# EasyEDA Pro project ProPrj_DRV8701 - 副本_2026-07-18.epro, board PCB5_1
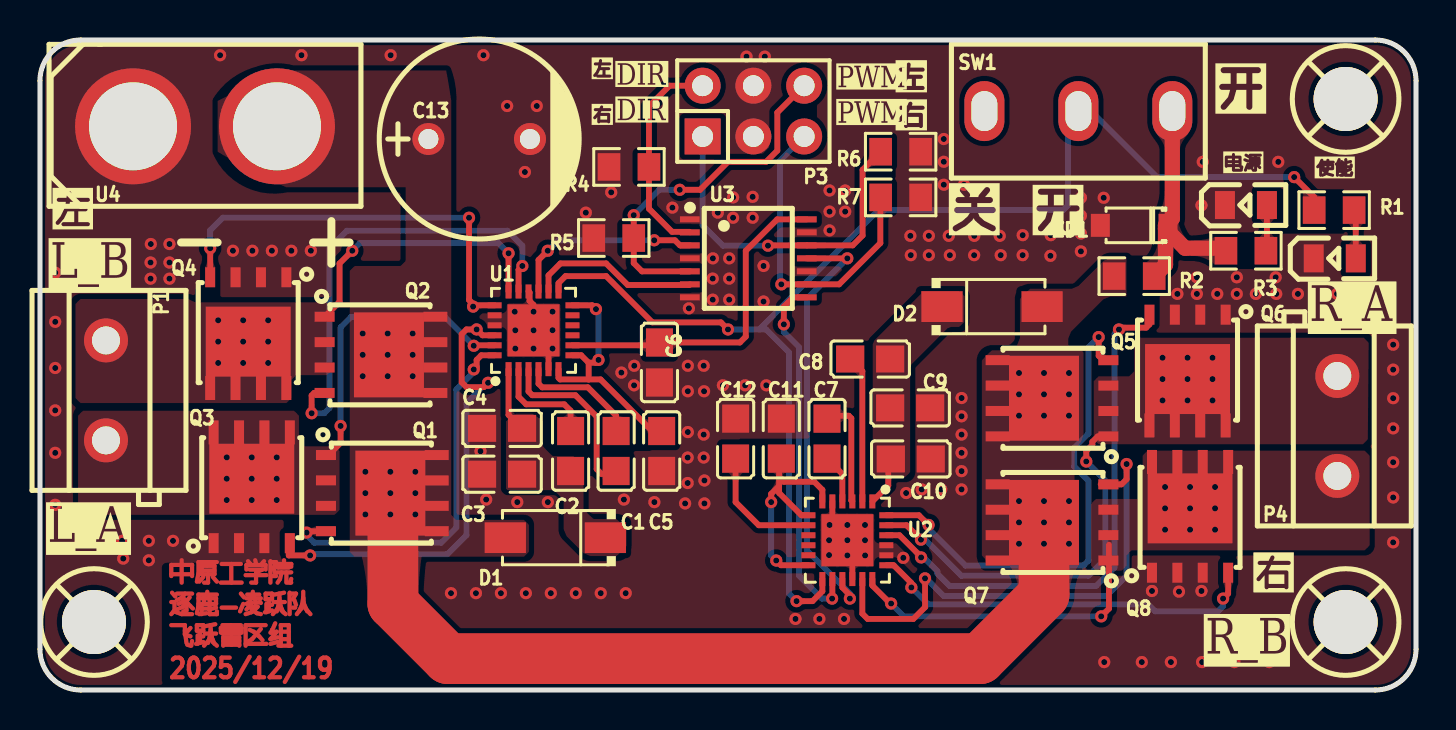
[diagram p8: board, top side]
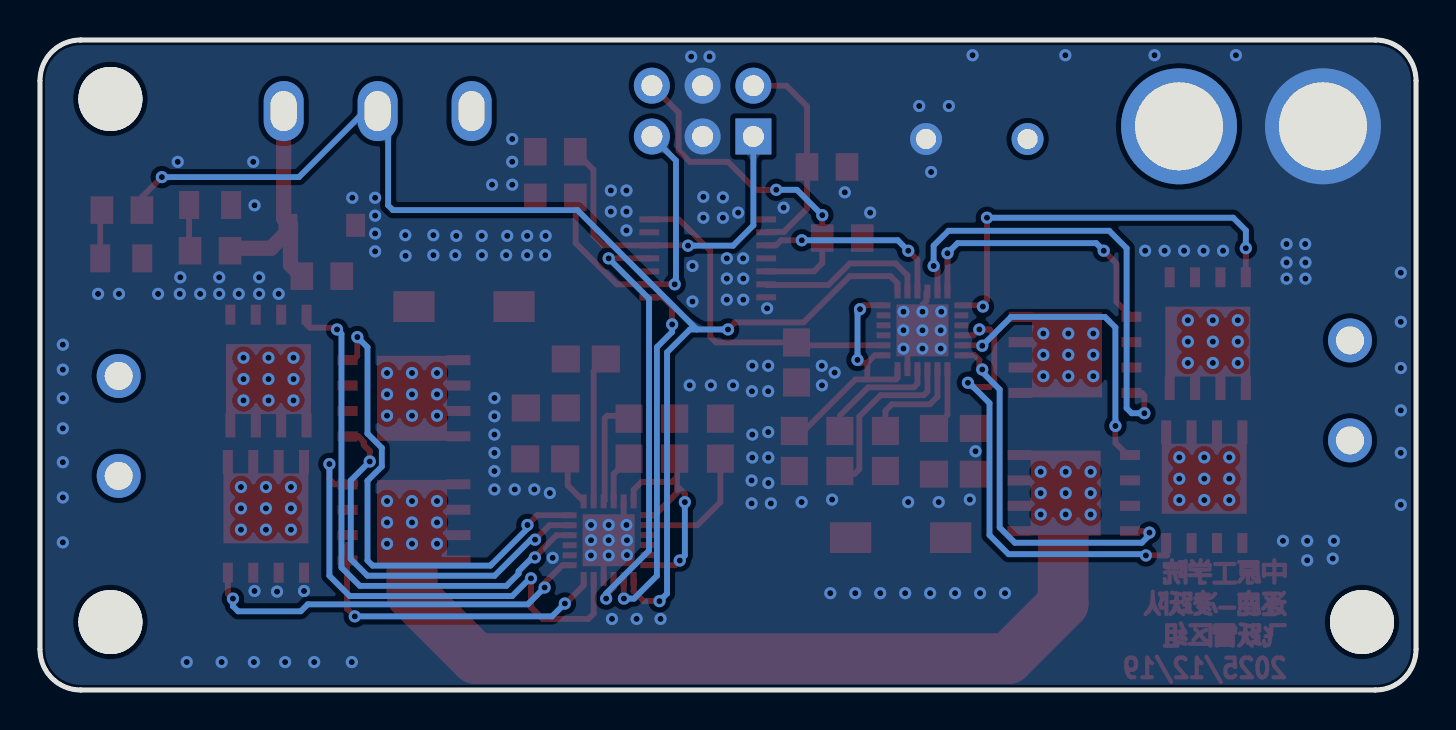
[diagram p9: board, bottom side, seen from below]

Outline 68.83 x 32.51 mm; copper layers: Top Layer, Bottom Layer. Coordinates in mm from the lower left corner of the outline.
Outline path: 0,30.48 0,2.03 arc(0.6,0.6) 2.03,0 66.8,0 arc(68.24,0.6) 68.83,2.03 68.83,30.48 arc(68.24,31.92) 66.8,32.51 2.03,32.51 arc(0.6,31.92) 0,30.48
Stack: Top Layer 0.035mm / Dielectric1 1.51mm FR4 er 4.5 / Bottom Layer 0.035mm

## Design rules (mm)
template: 自定义配置
spacing copperThickness1oz (default): track to track 0.102, other pairs 0.152 to 0.3
spacing copperThickness2oz: track to track 0.203, other pairs 0.152 to 0.3
track width copperThickness1oz (default): min 0.127, default 0.254, max 2.54
track width copperThickness2oz: min 0.203, default 0.254, max 2.54
differential pair differentialPair (default): width min 0.127, default 0.254, max 2.54; gap min 0.152, default 0.152
via viaSize (default): diameter min 0.5, default 0.61, max 10; hole min 0.3, default 0.305, max 6.3

## Placement (name value [footprint] x y rotation side)
C1  100nF  [C0805]  28.82 11.95 270 top
C2  1uF  [C0805]  26.54 11.95 270 top
C3  10uF  [C0805]  23.11 10.8 180 top
C4  100nF  [C0805]  23.11 13.09 180 top
C5  1uF  [C0805]  31.1 11.95 90 top
C6  1uF  [C0805]  30.99 16.38 90 top
C7  100nF  [C0805]  39.37 12.57 90 top
C8  1uF  [C0805]  41.53 16.55 0 top
C9  10uF  [C0805]  43.53 14.11 0 top
C10  100nF  [C0805]  43.56 11.56 0 top
C11  1uF  [C0805]  37.08 12.57 270 top
C12  1uF  [C0805]  34.8 12.57 270 top
C13  470uF  [CAP-TH_BD10.0-P5.00-D1.0-FD]  21.97 27.56 0 top
D1  SS54  [SMA_L4.4-W2.8-LS5.4-R-RD]  25.78 7.62 180 top
D2  SS54  [SMA_L4.4-W2.8-LS5.4-R-RD]  47.62 19.18 0 top
P1  KF301-5.0-2P  [CONN-TH_P5.00_KF301-5.0-2P]  3.3 14.99 270 top
P3  2.54-2*3P针  [HDR-TH_6P-P2.54-V-M-R2-C3-S2.54-1]  35.69 28.96 0 top
P4  KF301-5.0-2P  [CONN-TH_P5.00_KF301-5.0-2P]  64.9 13.21 90 top
Q1  TPH1R403NL,L1Q(M  [DSOP-8_L5.0-W5.0-P1.27-LS6.0-BL-EP]  17.08 9.85 270 top
Q2  TPH1R403NL,L1Q(M  [DSOP-8_L5.0-W5.0-P1.27-LS6.0-BL-EP]  17.01 16.76 270 top
Q3  TPH1R403NL,L1Q(M  [DSOP-8_L5.0-W5.0-P1.27-LS6.0-BL-EP]  10.59 10.12 0 top
Q4  TPH1R403NL,L1Q(M  [DSOP-8_L5.0-W5.0-P1.27-LS6.0-BL-EP]  10.42 17.88 180 top
Q5  TPH1R403NL,L1Q(M  [DSOP-8_L5.0-W5.0-P1.27-LS6.0-BL-EP]  50.67 14.59 90 top
Q6  TPH1R403NL,L1Q(M  [DSOP-8_L5.0-W5.0-P1.27-LS6.0-BL-EP]  57.4 16 180 top
Q7  TPH1R403NL,L1Q(M  [DSOP-8_L5.0-W5.0-P1.27-LS6.0-BL-EP]  50.67 8.38 90 top
Q8  TPH1R403NL,L1Q(M  [DSOP-8_L5.0-W5.0-P1.27-LS6.0-BL-EP]  57.53 8.64 0 top
R1  330Ω  [R0805]  64.74 24 0 top
R2  2.2kΩ  [R0805]  54.74 20.7 0 top
R3  1kΩ  [R0805]  60.33 21.97 180 top
R4  10kΩ  [R0805]  29.46 26.16 180 top
R5  10kΩ  [R0805]  28.7 22.61 180 top
R6  10kΩ  [R0805]  43.05 26.92 180 top
R7  10kΩ  [R0805]  43.05 24.64 180 top
SCREW2  -  [M3螺丝]  2.7 3.4 0 top
SCREW3  -  [M3螺丝]  65.31 29.56 0 top
SCREW4  -  [M3螺丝]  65.31 3.4 0 top
SW1  SS-12D10L5  [SW-TH_SS-12D10L5]  51.94 28.96 0 top
U1  DRV8701ERGET  [VQFN-24_L4.0-W4.0-P0.50-BL-EP2.5]  24.69 17.99 0 top
U2  DRV8701ERGET  [VQFN-24_L4.0-W4.0-P0.50-BL-EP2.5]  40.39 7.49 180 top
U3  SN74HC125PWR  [TSSOP-14_L5.0-W4.4-P0.65-LS6.5-BL]  35.43 21.59 270 top
U4  XT60  [CONN-TH_XT60]  8.25 28.19 0 top
ZD1  BZT52C3V3  [SOD-123_L2.8-W1.8-LS3.7-RD]  54.74 23.24 180 top
使能  NCD0805R1  [LED0805-R-RD]  64.77 21.59 0 top
电源  NCD0805R1  [LED0805-R-RD]  60.33 24.26 0 top

## Footprints (pads in the part's own frame, mm; a bottom-side part is the same pattern mirrored in y, then rotated)
C0805
  rect 1.41x1.35 smd: 1(-1,0) 2(1,0)
CAP-TH_BD10.0-P5.00-D1.0-FD
  round 1.6 hole 1: 1(-2.54,0) 2(2.54,0)
CONN-TH_P5.00_KF301-5.0-2P
  round 2.2 hole 1.4: 1(-2.5,0) 2(2.5,0)
CONN-TH_XT60
  round 5.8 hole 4.4: 1(-3.6,0) 2(3.6,0)
DSOP-8_L5.0-W5.0-P1.27-LS6.0-BL-EP
  rect 0.5x1 smd: 1(-1.905,-2.77) 2(-0.635,-2.77) 3(0.634,-2.77) 4(1.905,-2.77)
  rect 0.5x1.2 smd: 5(1.905,2.77) 6(0.635,2.77) 7(-0.634,2.77) 8(-1.905,2.77)
  custom 4.25x3.5 smd: 9(0,0.45)
HDR-TH_6P-P2.54-V-M-R2-C3-S2.54-1
  rect 1.8x1.8 hole 1.05: 1(-2.54,-1.27)
  round 1.8 hole 1.05: 2(-2.54,1.27) 3(0,-1.27) 4(0,1.27) 5(2.54,-1.27) 6(2.54,1.27)
LED0805-R-RD
  rect 1x1.399 smd: 1(1.05,0) 2(-1.05,0)
M3螺丝
  round 3.2 hole 3.2: 1(0,0)
R0805
  rect 1.133x1.377 smd: 1(-1,0) 2(1,0)
SMA_L4.4-W2.8-LS5.4-R-RD
  rect 2.062x1.539 smd: 1(2.503,0) 2(-2.503,0)
SOD-123_L2.8-W1.8-LS3.7-RD
  rect 0.95x1.15 smd: 1(-1.692,0) 2(1.692,0)
SW-TH_SS-12D10L5
  oval 2x3 hole 1.3x2: 1(-4.7,0) 2(0,0) 3(4.7,0)
TSSOP-14_L5.0-W4.4-P0.65-LS6.5-BL
  rect 0.305x0.991 smd: 1(-1.95,-2.925) 2(-1.3,-2.925) 3(-0.65,-2.925) 4(0,-2.925) 5(0.65,-2.925) 6(1.3,-2.925) 7(1.95,-2.925) 8(1.95,2.925) 9(1.3,2.925) 10(0.65,2.925) 11(0,2.925) 12(-0.65,2.925) 13(-1.3,2.925) 14(-1.95,2.925)
VQFN-24_L4.0-W4.0-P0.50-BL-EP2.5
  rect 0.3x0.7 smd: 1(-1.25,-1.942) 2(-0.75,-1.942) 3(-0.25,-1.942) 4(0.25,-1.942) 5(0.75,-1.942) 6(1.25,-1.942) 13(1.25,1.942) 14(0.75,1.942) 15(0.25,1.942) 16(-0.25,1.942) 17(-0.75,1.942) 18(-1.25,1.942)
  rect 0.7x0.3 smd: 7(1.948,-1.25) 8(1.948,-0.75) 9(1.948,-0.25) 10(1.948,0.25) 11(1.948,0.75) 12(1.948,1.25) 19(-1.948,1.25) 20(-1.948,0.75) 21(-1.948,0.25) 22(-1.948,-0.25) 23(-1.948,-0.75) 24(-1.948,-1.25)
  rect 2.6x2.6 smd: 25(0.001,-0.001)

## Nets
3V3: R2.2 R3.2 SW1.3 ZD1.1
DVDD: C6.2 U1.8 U3.14
GND: C3.2 C4.2 C5.1 C6.1 C9.2 C10.2 C11.1 C12.1 C13.2 P3.3 P3.4 Q3.1 Q3.2 Q3.3 Q4.1 Q4.2 Q4.3 Q6.1 Q6.2 Q6.3 Q8.1 Q8.2 Q8.3 R4.2 R5.2 R6.1 R7.1 U1.5 U1.16 U1.20 U1.21 U1.25 U2.5 U2.16 U2.20 U2.21 U2.25 U3.1 U3.4 U3.7 U3.10 U3.13 U4.1 ZD1.2 使能.2 电源.2
L_A: P1.2 Q1.1 Q1.2 Q1.3 Q3.5 Q3.6 Q3.7 Q3.8 Q3.9 U1.23
L_B: P1.1 Q2.1 Q2.2 Q2.3 Q4.5 Q4.6 Q4.7 Q4.8 Q4.9 U1.18
L_EN: U1.14 U3.6
L_EN_IN: P3.6 R5.1 U3.5
L_PH: U1.15 U3.3
L_PH_IN: P3.2 R4.1 U3.2
NSLEEP: R1.1 SW1.2 U1.13 U2.13
R_A: P4.2 Q5.1 Q5.2 Q5.3 Q6.5 Q6.6 Q6.7 Q6.8 Q6.9 U2.23
R_B: P4.1 Q7.1 Q7.2 Q7.3 Q8.5 Q8.6 Q8.7 Q8.8 Q8.9 U2.18
R_EN: U2.14 U3.8
R_EN_IN: P3.5 R7.2 U3.9
R_PH: U2.15 U3.11
R_PH_IN: P3.1 R6.2 U3.12
VM: C13.1 D1.1 D2.1 Q1.5 Q1.6 Q1.7 Q1.8 Q1.9 Q2.5 Q2.6 Q2.7 Q2.8 Q2.9 Q5.5 Q5.6 Q5.7 Q5.8 Q5.9 Q7.5 Q7.6 Q7.7 Q7.8 Q7.9 R2.1 U4.2
$1N2278: C2.2 C3.1 C4.1 D1.2 U1.1
$1N2281: C5.2 U1.6 U1.7 U1.12
$1N2285: C1.1 U1.4
$1N2286: C2.1 U1.2
$1N2287: C1.2 U1.3
$1N2291: Q3.4 U1.22
$1N2292: Q1.4 U1.24
$1N2296: Q2.4 U1.17
$1N2297: Q4.4 U1.19
$1N2305: C7.1 U2.4
$1N2306: C7.2 U2.3
$1N2307: C8.1 U2.2
$1N2308: C8.2 C9.1 C10.1 D2.2 U2.1
$1N2311: C11.2 U2.6 U2.7 U2.12
$1N2312: C12.2 U2.8
$1N2313: Q5.4 U2.24
$1N2320: Q6.4 U2.22
$1N2321: Q8.4 U2.19
$1N2322: Q7.4 U2.17
$1N2343: R1.2 使能.1
$1N2355: R3.1 电源.1

Pads without a net: SCREW2 1; SCREW3 1; SCREW4 1; SW1 1; U1 9 10 11; U2 9 10 11

## Via types
v1: diameter 0.61, hole 0.305, Top Layer to Bottom Layer, 285 vias

## Routing (per net, layer and track width the routed paths; a pad name or vN(x,y) marks a point on that pad's centre or on a via; arc(x,y) is an arc through that point)
3V3: length 13.1
  Top Layer w0.762: 56.3,23.07 56.3,23.24 56.64,23.58 56.64,29.97 ; 56.3,23.07 57.28,22.1 59.2,22.1 R3.2 ; 56.3,23.07 56.3,21.27 R2.2
DVDD: length 16.8
  Top Layer w0.292: U3.14 36.88,23.54 35.31,21.97 35.31,17.68 35.01,17.38 C6.2 30.85,17.24 26.64,17.24
GND: length 4.7
  Top Layer w0.292: U2.5 39.64,8.4 v1(39.5,8.26) ; v1(25.64,17.08) 25.44,16.88 U1.5 ; U1.16 24.49,19.88 24.49,19.46 24.69,19.26 v1(24.69,18.92) ; U2.16 40.64,6.48 v1(40.39,6.73)
  vias: v1(0.76,20.87) v1(0.76,18.42) v1(0.76,16.11) v1(0.76,13.99) v1(0.76,11.86) v1(0.76,9.26) v1(4.11,7.46) v1(4.16,6.57) v1(5.44,7.46) v1(5.44,6.49) v1(5.55,22.31) v1(5.53,21.38) v1(5.53,20.57) v1(6.48,22.31) v1(6.48,21.38) v1(6.48,20.57) v1(6.66,7.46) v1(9.01,31.75) v1(9.65,21.97) v1(10.63,21.97) v1(11.6,21.97) v1(12.58,21.97) v1(13.08,31.75) v1(13.55,21.97) v1(17.54,31.75) v1(20.56,4.84) v1(21.81,4.84) v1(22.04,11.94) v1(22.18,31.75) v1(22.32,9.53) v1(23.06,4.84) v1(23.37,29.21) v1(23.75,18.92) v1(23.78,17.99) v1(23.78,17.08) v1(23.88,9.4) v1(24.26,25.91) v1(24.31,4.84) v1(24.69,17.99) v1(24.69,17.08) v1(24.85,29.21) v1(25.41,9.4) v1(25.55,4.84) v1(25.64,18.92) v1(25.64,18) v1(26.8,4.84) v1(27.3,23.88) v1(28.05,4.84) v1(28.58,24.89) v1(29.08,15.88) v1(29.21,9.53) v1(29.3,4.84) v1(29.73,16.22) v1(29.72,15.24) v1(30.73,9.4) v1(31.64,24.13) v1(32.27,9.33) v1(32.46,19.09) v1(32.41,16.22) v1(32.41,14.94) v1(32.41,12.9) v1(32.4,11.63) v1(32.4,10.35) v1(33.2,16.22) v1(33.22,14.94) v1(33.2,12.77) v1(33.2,11.63) v1(33.24,10.48) v1(33.24,9.33) v1(33.66,21.59) v1(33.65,20.58) v1(33.65,19.52) v1(33.91,23.88) v1(34.16,15.24) v1(34.48,21.59) v1(34.48,20.58) v1(34.48,19.52) v1(34.67,24.64) v1(34.67,23.62) v1(35.27,15.24) v1(35.34,31.68) v1(35.65,24.67) v1(35.65,23.62) v1(36.26,31.68) v1(36.2,21.21) v1(36.2,19.43) v1(36.33,15.24) v1(37.79,3.56) v1(38.99,3.56) v1(39.47,7.49) v1(39.47,6.75) v1(39.5,24.98) v1(39.5,23.93) v1(39.5,22.99) v1(40.22,3.56) v1(40.28,24.98) v1(40.28,23.93) v1(40.39,8.26) v1(40.39,7.49) v1(41.27,8.26) v1(41.27,7.49) v1(41.27,6.73) v1(43.19,6.61) v1(43.33,9.85) v1(43.54,22.72) v1(43.56,21.75) v1(44.11,10.03) v1(44.46,22.72) v1(44.46,21.75) v1(45.08,10.03) v1(45.21,27.56) v1(45.21,26.42) v1(45.21,25.27) v1(45.46,22.72) v1(45.52,21.75) v1(46.1,14.61) v1(46.1,13.69) v1(46.1,12.78) v1(46.1,11.86) v1(46.1,10.95) v1(46.1,10.03) v1(46.22,25.27) v1(46.74,22.72) v1(46.73,21.75) v1(48.01,22.72) v1(48.06,21.75) v1(49.16,22.75) v1(49.16,21.75) v1(50.56,22.75) v1(50.55,21.72) v1(52.07,24.62) v1(52.07,23.73) v1(52.07,22.83) v1(52.07,21.94) v1(53.21,24.62) v1(53.24,1.4) v1(55.12,1.4) v1(55.63,4.95) v1(56.57,1.4) v1(56.9,19.81) v1(56.98,4.92) v1(57.87,20.64) v1(57.87,19.81) v1(58.17,26.42) v1(58.1,24.24) v1(58.1,4.95) v1(58.13,1.4) v1(58.89,19.81) v1(59.75,1.4) v1(59.87,20.64) v1(59.87,19.81) v1(60.82,19.81) v1(61.49,1.4) v1(61.81,20.64) v1(61.84,19.81) v1(61.94,26.42) v1(62.93,19.81) v1(64.88,19.81) v1(65.93,19.81) v1(67.69,17.27) v1(67.69,16.02) v1(67.69,14.6) v1(67.69,13.09) v1(67.69,11.39) v1(67.69,9.63) v1(67.69,7.38)
L_A: length 15.2
  Top Layer w0.292: U1.23 21.72,17.24 v1(21.7,17.22) ; v1(15.04,13.21) 15.04,12.36 14.43,11.75
  Bottom Layer w0.292: v1(15.04,13.21) 15.04,18.14 15.56,18.66 20.26,18.66 v1(21.7,17.22)
  vias: v1(9.34,11.64) v1(9.34,10.57) v1(9.34,9.5) v1(10.59,11.64) v1(10.59,10.57) v1(10.59,9.5) v1(11.84,11.64) v1(11.84,10.57) v1(11.84,9.5)
L_B: length 14
  Top Layer w0.292: U1.18 v1(23.44,21.84) ; v1(15.62,21.97) 14.99,21.34 14.99,19.42 Q2.1
  Bottom Layer w0.292: v1(23.44,21.84) 22.93,22.35 16,22.35 v1(15.62,21.97)
  vias: v1(8.91,18.49) v1(8.91,17.43) v1(8.91,16.36) v1(10.16,18.49) v1(10.16,17.43) v1(10.16,16.36) v1(11.41,18.49) v1(11.41,17.43) v1(11.41,16.36)
L_EN: length 8.6
  Top Layer w0.292: U3.6 32.47,20.26 29.4,20.26 28.32,21.34 26.03,21.34 25.44,20.74 U1.14
L_EN_IN: length 17.7
  Top Layer w0.292: v1(29.7,23.75) R5.1 29.7,21.35 30.11,20.94 32.51,20.94 ; v1(32,25.02) 33.02,25.02 34.42,26.42 36.32,26.42 36.89,26.98 36.89,28.88 P3.6
  Bottom Layer w0.292: v1(32,25.02) 30.97,25.02 v1(29.7,23.75)
L_PH: length 9.7
  Top Layer w0.292: v1(30.73,22.49) 31.76,22.49 32.02,22.24 U3.3 ; U1.15 24.94,21.51 v1(25.4,21.97)
  Bottom Layer w0.292: v1(25.4,21.97) 25.92,22.49 v1(30.73,22.49)
L_PH_IN: length 10.8
  Top Layer w0.292: P3.2 31.5,30.23 30.46,29.19 R4.1 30.46,24.07 31.62,22.92 32.48,22.92 U3.2
NSLEEP: length 65.7
  Top Layer w0.292: v1(34.42,18.03) 34.06,18.39 30.64,18.39 28.32,20.7 26.29,20.7 25.94,20.35 U1.13 ; R1.1 63.74,24.65 v1(62.74,25.65) ; U2.13 39.14,4.94 38.64,4.45 v1(37.85,4.45)
  Bottom Layer w0.292: v1(34.42,18.03) 35.98,18.03 ; 35.98,18.03 36.32,18.03 37.46,16.89 37.46,4.83 v1(37.85,4.45) ; 35.98,18.03 41.95,24 51.18,24 51.42,24.24 51.42,28.3 51.94,28.83 SW1.2 ; v1(62.74,25.65) 55.88,25.65 52.45,29.08 52.45,28.96 52.14,28.65
R_A: length 19.6
  Top Layer w0.292: v1(52.34,11.43) 52.34,11.96 52.64,12.26 52.64,12.42 52.91,12.69 Q5.1 ; U2.23 43.35,8.24 v1(44.07,7.52)
  Bottom Layer w0.292: v1(52.34,11.43) 53.29,10.48 53.29,6.55 52.45,5.72 46.09,5.72 44.29,7.52 v1(44.07,7.52)
  vias: v1(56.15,16.62) v1(56.15,15.55) v1(56.15,14.48) v1(57.4,16.62) v1(57.4,15.55) v1(57.4,14.48) v1(58.65,16.62) v1(58.65,15.55) v1(58.65,14.48)
R_B: length 16.2
  Top Layer w0.292: 53.47,7.27 53.47,4.07 v1(53.09,3.68) ; v1(42.58,4.33) 42.54,4.33 41.64,5.23 U2.18
  Bottom Layer w0.292: v1(42.58,4.33) 43.22,3.68 v1(53.09,3.68)
  vias: v1(56.28,10.15) v1(56.28,9.09) v1(56.28,8.02) v1(57.53,10.15) v1(57.53,9.09) v1(57.53,8.02) v1(58.78,10.15) v1(58.78,9.09) v1(58.78,8.02)
R_EN: length 18.2
  Top Layer w0.292: U2.14 39.64,4.59 v1(39.62,4.57) ; v1(37.21,18.29) 37.21,19.18 37.67,19.64 U3.8
  Bottom Layer w0.292: v1(37.21,18.29) 37.21,17.91 37.97,17.15 37.97,5.72 39.12,4.57 v1(39.62,4.57)
R_EN_IN: length 16
  Top Layer w0.292: v1(37.08,20.29) U3.9 39.98,20.29 42.04,22.35 42.04,24.62
  Bottom Layer w0.292: v1(37.08,20.29) 37.02,20.35 37.02,26.48 P3.5
R_PH: length 21.9
  Top Layer w0.292: v1(40.51,4.57) 40.51,4.75 40.14,5.13 U2.15 ; v1(40.39,21.59) U3.11
  Bottom Layer w0.292: v1(40.39,21.59) 38.37,19.57 38.37,6.97 40.51,4.83 v1(40.51,4.57)
R_PH_IN: length 17.6
  Top Layer w0.292: R6.2 41.15,26.02 41.15,22.73 40.65,22.24 U3.12 36.43,22.24 v1(36.42,22.23)
  Bottom Layer w0.292: P3.1 33.15,23.24 34.16,22.23 v1(36.42,22.23)
VM: length 44.2
  Top Layer w2.54: 17.65,9.85 17.65,4.32 20.4,1.57 47.03,1.57 50.22,4.77 v1(50.22,7.32) v1(50.22,8.38)
  vias: v1(16.14,17.83) v1(16.14,16.76) v1(16.14,15.7) v1(16.28,10.92) v1(16.28,9.85) v1(16.28,8.78) v1(17.39,17.83) v1(17.39,16.76) v1(17.39,15.7) v1(17.53,10.92) v1(17.53,9.85) v1(17.53,8.78) v1(18.64,17.83) v1(18.64,16.76) v1(18.64,15.7) v1(18.78,10.92) v1(18.78,9.85) v1(18.78,8.78) v1(48.97,15.86) v1(48.97,14.79) v1(48.97,13.72) v1(48.97,9.45) v1(48.97,8.38) v1(48.97,7.32) v1(50.22,15.86) v1(50.22,14.79) v1(50.22,13.72) v1(50.22,9.45) v1(51.47,15.86) v1(51.47,14.79) v1(51.47,13.72) v1(51.47,9.45) v1(51.47,8.38) v1(51.47,7.32)
$1N2278: length 3.2
  Top Layer w0.292: C4.1 23.44,13.76 U1.1
$1N2281: length 12.9
  Top Layer w0.292: 27.45,15.53 26.02,15.53 25.94,15.61 U1.6 ; 27.45,15.53 27.45,16.37 ; 27.45,15.53 28.04,15.53 30.62,12.95 C5.2 ; 27.45,16.37 27.07,16.74 26.64,16.74 ; 27.45,16.37 27.8,16.37 v1(27.94,16.51) ; v1(27.81,19.05) 27.62,19.24 26.64,19.24
  Bottom Layer w0.292: v1(27.81,19.05) 27.94,18.92 v1(27.94,16.51)
$1N2285: length 6
  Top Layer w0.292: U1.4 24.94,15.32 25.12,15.14 27.41,15.14 28.82,13.72 C1.1
$1N2286: length 5.3
  Top Layer w0.292: C2.1 26.54,13.97 26.22,14.29 24.32,14.29 23.94,14.67 U1.2
$1N2287: length 8.8
  Top Layer w0.292: U1.3 24.44,14.93 24.62,14.75 26.78,14.75 27.85,13.68 27.85,11.05 28.09,10.81 28.68,10.81 C1.2
$1N2291: length 23.6
  Top Layer w0.292: U1.22 22.14,17.74 v1(21.84,18.03) 21.33,18.03 21.1,17.8 21.1,15.39 21.34,15.15 22.2,15.15 v1(22.42,15.37) ; 12.45,7.14 12.45,6.73 v1(13.51,6.73)
  Bottom Layer w0.292: v1(22.42,15.37) 22.35,15.37 21.34,14.35 21.34,7.75 20.38,6.79 13.58,6.79 v1(13.51,6.73)
$1N2292: length 19
  Top Layer w0.292: U1.24 22.08,16.74 21.84,16.51 21.84,16.18 v1(21.7,16.03) ; v1(13.33,7.87) 13.4,7.94 14.43,7.94
  Bottom Layer w0.292: v1(21.7,16.03) 21.7,15.91 20.83,15.04 20.83,8.13 20.07,7.37 13.72,7.37 13.33,7.75 v1(13.33,7.87)
$1N2296: length 23.3
  Top Layer w0.292: U1.17 23.94,21.02 v1(24.13,21.21) ; Q2.4 13.72,14.86 13.59,14.73 v1(13.59,13.84)
  Bottom Layer w0.292: v1(24.13,21.21) 24.13,22.23 23.38,22.97 15.35,22.97 14.48,22.1 14.48,14.1 14.22,13.84 v1(13.59,13.84)
$1N2297: length 21.2
  Top Layer w0.292: Q4.4 v1(8.51,22.1) ; U1.19 21.73,19.24 ; 21.73,19.24 21.46,19.51 v1(21.46,23.62) ; 21.73,19.24 v1(21.67,19.18)
  Bottom Layer w0.292: v1(8.51,22.1) 8.51,22.99 9.14,23.62 v1(21.46,23.62)
$1N2305: length 2.5
  Top Layer w0.292: C7.1 40.14,10.81 U2.4
$1N2306: length 5.5
  Top Layer w0.292: C7.2 39.51,13.72 40.46,13.72 40.59,13.59 40.59,9.48 U2.3
$1N2307: length 7.4
  Top Layer w0.292: C8.1 41.14,15.95 U2.2
$1N2308: length 2.5
  Top Layer w0.292: U2.1 42.43,10.23 42.43,11.56
$1N2311: length 12.4
  Top Layer w0.292: U2.6 39.14,10.01 38.73,10.41 37.21,10.41 36.97,10.65 ; v1(36.58,9.4) 36.58,9.81 36.97,10.21 ; U2.12 37.07,6.24 v1(36.83,6.48) ; 36.97,10.21 36.97,9.86 38.09,8.74 U2.7 ; 36.97,10.21 36.97,10.65 ; C11.2 36.97,11.46 36.97,10.65
  Bottom Layer w0.292: v1(36.83,6.48) 36.58,6.73 v1(36.58,9.4)
$1N2312: length 6.3
  Top Layer w0.292: C12.2 34.8,9.4 35.95,8.24 U2.8
$1N2313: length 24.9
  Top Layer w0.292: v1(52.96,17.65) 52.96,16.72 53.17,16.51 53.43,16.51 Q5.4 ; v1(44.45,8.26) 43.96,8.74 U2.24
  Bottom Layer w0.292: v1(52.96,17.65) 52.45,17.15 52.45,12.83 51.73,12.11 51.73,11.18 52.45,10.46 52.45,6.48 52.2,6.22 46.3,6.22 44.45,8.07 v1(44.45,8.26)
$1N2320: length 27.1
  Top Layer w0.292: v1(53.98,18.03) 54.06,18.12 55.33,18.12 55.5,18.29 Q6.4 ; v1(44.08,6.63) 44.08,6.66 42.99,7.74 U2.22
  Bottom Layer w0.292: v1(53.98,18.03) 53.75,17.81 53.75,6.13 52.83,5.21 45.5,5.21 44.89,5.82 44.89,5.94 44.2,6.63 v1(44.08,6.63)
$1N2321: length 19.8
  Top Layer w0.292: v1(43.59,5.13) 43.59,5.35 42.7,6.24 U2.19 ; v1(59.18,4.57) 59.44,4.83 59.44,5.87
  Bottom Layer w0.292: v1(59.18,4.57) 59.18,4.19 58.93,3.94 55.79,3.94 55.44,4.29 44.43,4.29 v1(43.59,5.13)
$1N2322: length 25.3
  Top Layer w0.292: v1(44.27,5.58) 44.27,4.14 43.69,3.56 41.4,3.56 41.14,3.82 U2.17 ; v1(54.36,11.3) 54.36,10.54 54.1,10.29 53.06,10.29
  Bottom Layer w0.292: v1(54.36,11.3) 54.36,5.72 53.34,4.7 45.21,4.7 44.33,5.58 v1(44.27,5.58)
$1N2343: length 2.4
  Top Layer w0.292: 使能.1 65.82,23.92 R1.2
$1N2355: length 2.3
  Top Layer w0.292: 电源.1 61.38,22.02 R3.1

## Copper pours and planes (outline as drawn; the poured copper is in the pictures)
GND on Top Layer: -2.54,35.05 72.01,35.05 72.01,-0.25 -2.54,-0.25
GND on Bottom Layer: -1.52,34.04 71.12,34.04 71.12,-1.02 -1.52,-1.02
L_A on Top Layer: 1.91,13.97 14.99,13.97 14.99,8.76 1.91,8.76
L_B on Top Layer: 1.78,19.56 14.6,19.56 14.6,14.35 1.78,14.35
R_A on Top Layer: 52.71,17.62 66.46,17.62 66.46,12.29 52.71,12.29
R_B on Top Layer: 52.58,11.97 66.51,11.97 66.51,5.97 52.58,5.97
VM on Top Layer: 8.89,30.99 24.46,30.99 24.46,6.67 8.89,6.67
VM on Top Layer: 47.12,21.62 54.35,21.62 54.35,6.22 47.12,6.22
$1N2278 on Top Layer: 23.31,13.82 29.34,13.82 29.34,6.7 23.31,6.7
$1N2308 on Top Layer: 41.66,19.94 46.25,19.94 46.25,10.65 41.66,10.65

Small or netless copper shapes (teardrops, artwork), in the pictures only: 90 on Top Layer, 32 on Bottom Layer

## Text on the board
Top Layer: 中原工学院 / 逐鹿—凌跃队 / 飞跃雷区组 / 2025/12/19
Top Solder Mask Layer: 中原工学院 / 逐鹿—凌跃队 / 飞跃雷区组 / 2025/12/19
Top Silkscreen Layer: - | + | 左 | 右 | DIR | PWM | L_A | L_B | 关 | 开 | R_B | R_A
